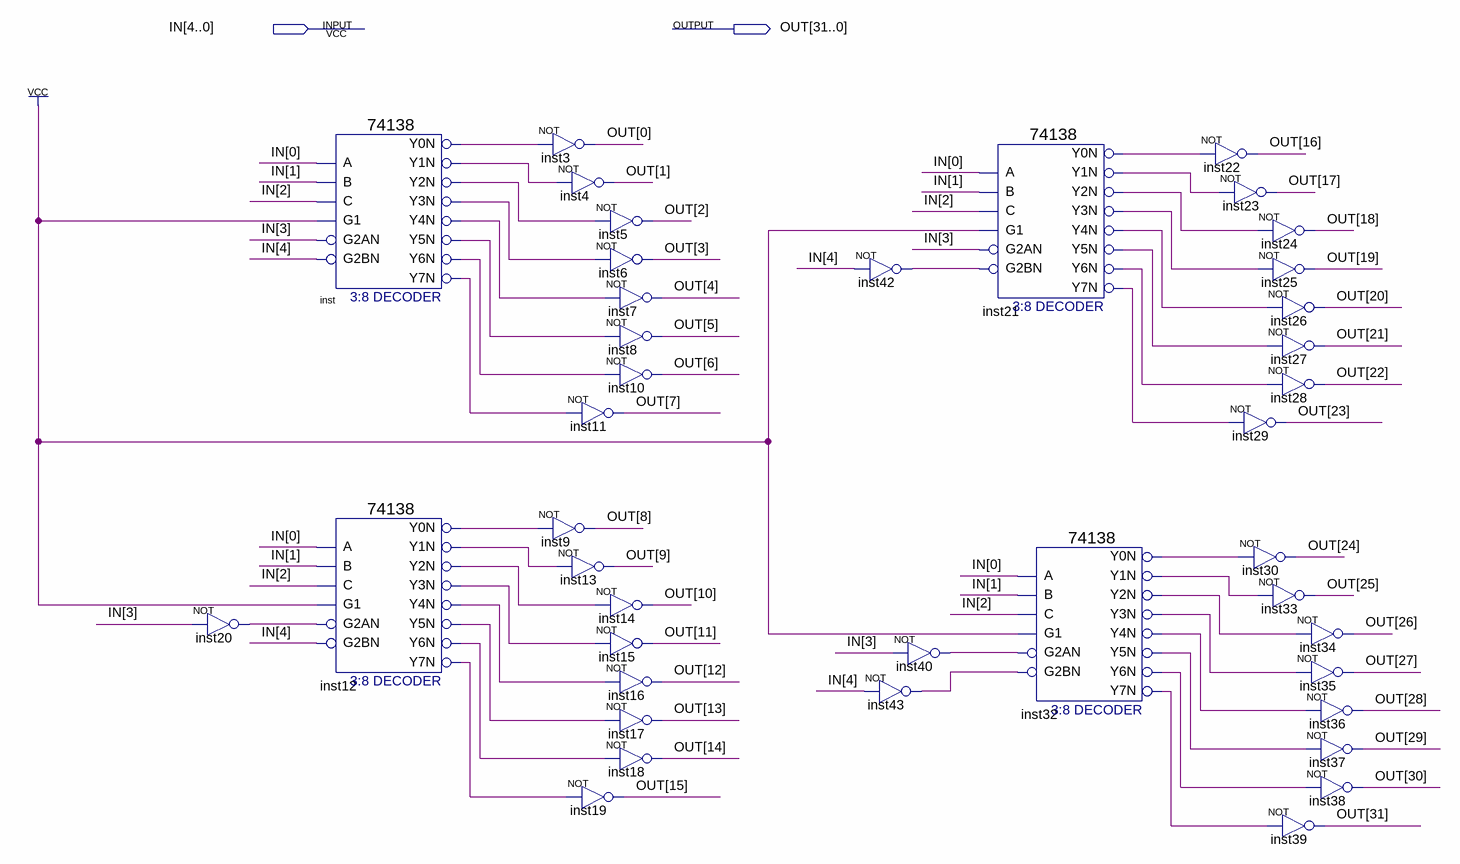
[diagram p0: schematic sheet]
// Quartus schematic selector.bdf as structural Verilog: 40 symbols, 2 pins
module selector (
  input  [4:0] IN,
  output [31:0] OUT
);

  wire inst12_y0n, inst12_y1n, inst12_y2n, inst12_y3n, inst12_y4n, inst12_y5n, inst12_y6n, inst12_y7n,
       inst20_out, inst21_y0n, inst21_y1n, inst21_y2n, inst21_y3n, inst21_y4n, inst21_y5n, inst21_y6n,
       inst21_y7n, inst32_y0n, inst32_y1n, inst32_y2n, inst32_y3n, inst32_y4n, inst32_y5n, inst32_y6n,
       inst32_y7n, inst40_out, inst42_out, inst43_out, inst_y0n, inst_y1n, inst_y2n, inst_y3n, inst_y4n,
       inst_y5n, inst_y6n, inst_y7n;

  not inst20 (inst20_out, IN[3]);
  \74138  inst (
    .A(IN[0]), .B(IN[1]), .G1(1'b1), .C(IN[2]), .G2AN(IN[3]), .G2BN(IN[4]), .Y0N(inst_y0n), .Y1N(inst_y1n),
    .Y2N(inst_y2n), .Y3N(inst_y3n), .Y4N(inst_y4n), .Y5N(inst_y5n), .Y6N(inst_y6n), .Y7N(inst_y7n));
  \74138  inst12 (
    .A(IN[0]), .B(IN[1]), .G1(1'b1), .C(IN[2]), .G2AN(inst20_out), .G2BN(IN[4]), .Y0N(inst12_y0n),
    .Y1N(inst12_y1n), .Y2N(inst12_y2n), .Y3N(inst12_y3n), .Y4N(inst12_y4n), .Y5N(inst12_y5n),
    .Y6N(inst12_y6n), .Y7N(inst12_y7n));
  not inst3 (OUT[0], inst_y0n);
  not inst9 (OUT[8], inst12_y0n);
  not inst4 (OUT[1], inst_y1n);
  not inst5 (OUT[2], inst_y2n);
  not inst6 (OUT[3], inst_y3n);
  not inst7 (OUT[4], inst_y4n);
  not inst8 (OUT[5], inst_y5n);
  not inst10 (OUT[6], inst_y6n);
  not inst11 (OUT[7], inst_y7n);
  not inst13 (OUT[9], inst12_y1n);
  not inst14 (OUT[10], inst12_y2n);
  not inst15 (OUT[11], inst12_y3n);
  not inst16 (OUT[12], inst12_y4n);
  not inst17 (OUT[13], inst12_y5n);
  not inst18 (OUT[14], inst12_y6n);
  not inst19 (OUT[15], inst12_y7n);
  not inst42 (inst42_out, IN[4]);
  not inst40 (inst40_out, IN[3]);
  not inst43 (inst43_out, IN[4]);
  \74138  inst21 (
    .A(IN[0]), .B(IN[1]), .G1(1'b1), .C(IN[2]), .G2AN(IN[3]), .G2BN(inst42_out), .Y0N(inst21_y0n),
    .Y1N(inst21_y1n), .Y2N(inst21_y2n), .Y3N(inst21_y3n), .Y4N(inst21_y4n), .Y5N(inst21_y5n),
    .Y6N(inst21_y6n), .Y7N(inst21_y7n));
  \74138  inst32 (
    .A(IN[0]), .B(IN[1]), .G1(1'b1), .C(IN[2]), .G2AN(inst40_out), .G2BN(inst43_out), .Y0N(inst32_y0n),
    .Y1N(inst32_y1n), .Y2N(inst32_y2n), .Y3N(inst32_y3n), .Y4N(inst32_y4n), .Y5N(inst32_y5n),
    .Y6N(inst32_y6n), .Y7N(inst32_y7n));
  not inst22 (OUT[16], inst21_y0n);
  not inst23 (OUT[17], inst21_y1n);
  not inst29 (OUT[23], inst21_y7n);
  not inst30 (OUT[24], inst32_y0n);
  not inst24 (OUT[18], inst21_y2n);
  not inst25 (OUT[19], inst21_y3n);
  not inst26 (OUT[20], inst21_y4n);
  not inst27 (OUT[21], inst21_y5n);
  not inst28 (OUT[22], inst21_y6n);
  not inst33 (OUT[25], inst32_y1n);
  not inst34 (OUT[26], inst32_y2n);
  not inst35 (OUT[27], inst32_y3n);
  not inst36 (OUT[28], inst32_y4n);
  not inst37 (OUT[29], inst32_y5n);
  not inst38 (OUT[30], inst32_y6n);
  not inst39 (OUT[31], inst32_y7n);
endmodule
